# Altium project PCB_tesis.PrjPcb
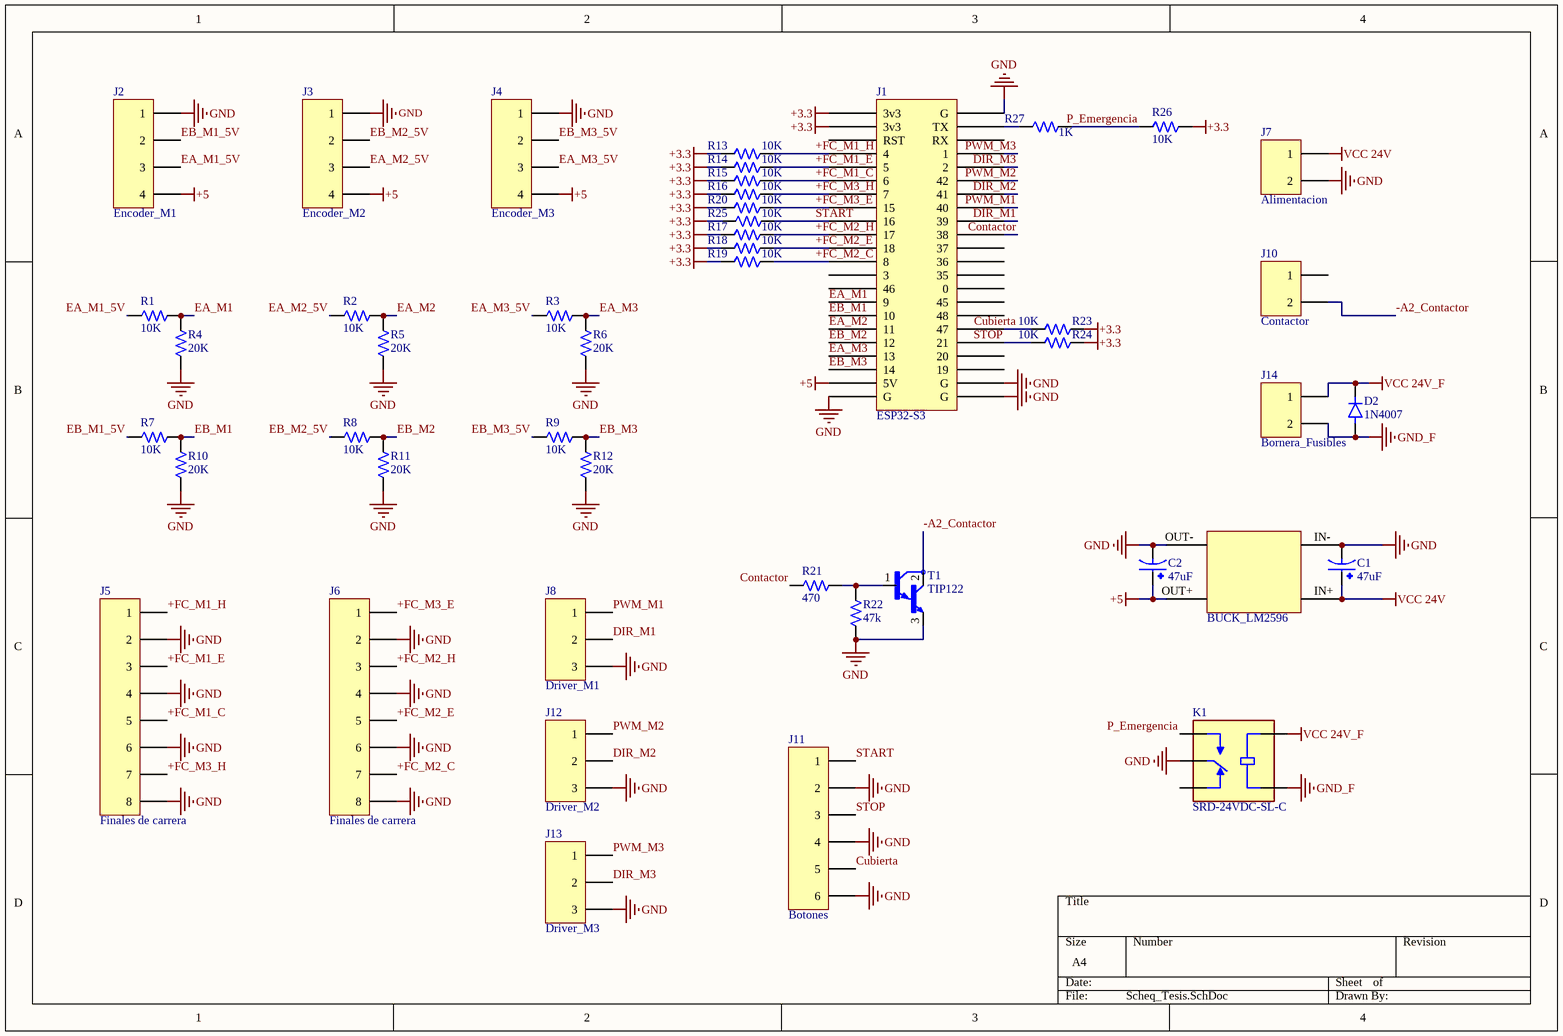
[diagram p0: Scheq_Tesis.SchDoc]
1 sheet, 46 parts. Net scope: global (net labels, ports and power ports of the same name join across sheets).
Board file: PCB_TESIS.PcbDoc

## Sheet Scheq_Tesis.SchDoc
size A4; SheetNumber: 1; SheetTotal: 1

### Parts
C1  47uF  [CAPPRD250W50D630H1120]
C2  47uF  [CAPPRD250W50D630H1120]
D2  1N4007  [DIOAD1060W80L520D270]
J1  ESP32-S3  [FootprintESP]
J2  Encoder_M1  [Bornera4_3.5mm]
J3  Encoder_M2  [Bornera4_3.5mm]
J4  Encoder_M3  [Bornera4_3.5mm]
J5  Finales de carrera  [Footprint bornera 8 pins]
J6  Finales de carrera  [Footprint bornera 8 pins]
J7  Alimentacion  [Bornera 2 5mm]
J8  Driver_M1  [Bornera 3 5mm]
J9  BUCK_LM2596  [BUCK_LM2596]
J10  Contactor  [Bornera 2 5mm]
J11  Botones  [footprint bornera 6]
J12  Driver_M2  [Bornera 3 5mm]
J13  Driver_M3  [Bornera 3 5mm]
J14  Bornera_Fusibles  [Bornera 2 5mm]
K1  SRD-24VDC-SL-C  [RELAY_SRD-12VDC-SL-C]
R1  10K  [RESAD1100W55L680D260]
R2  10K  [RESAD1100W55L680D260]
R3  10K  [RESAD1100W55L680D260]
R4  20K  [RESAD1100W55L680D260]
R5  20K  [RESAD1100W55L680D260]
R6  20K  [RESAD1100W55L680D260]
R7  10K  [RESAD1100W55L680D260]
R8  10K  [RESAD1100W55L680D260]
R9  10K  [RESAD1100W55L680D260]
R10  20K  [RESAD1100W55L680D260]
R11  20K  [RESAD1100W55L680D260]
R12  20K  [RESAD1100W55L680D260]
R13  10K  [RESAD1100W55L680D260]
R14  10K  [RESAD1100W55L680D260]
R15  10K  [RESAD1100W55L680D260]
R16  10K  [RESAD1100W55L680D260]
R17  10K  [RESAD1100W55L680D260]
R18  10K  [RESAD1100W55L680D260]
R19  10K  [RESAD1100W55L680D260]
R20  10K  [RESAD1100W55L680D260]
R21  470  [RESAD1100W55L680D260]
R22  47k  [RESAD1100W55L680D260]
R23  10K  [RESAD1100W55L680D260]
R24  10K  [RESAD1100W55L680D260]
R25  10K  [RESAD1100W55L680D260]
R26  10K  [RESAD1100W55L680D260]
R27  1K  [RESAD1100W55L680D260]
T1  TIP122  [TO220]

### Nets
+3.3: J1.1(3v3) J1.2(3v3) R13.1 R14.1 R15.1 R16.1 R17.1 R18.1 R19.1 R20.1 R23.2 R24.2 R25.2 R26.2
+5: C2.P J1.21(5V) J2.4 J3.4 J4.4 J9.OUT+
GND: C1.N C2.N J1.22(G) J1.23(G) J1.43(G) J1.44(G) J2.1 J3.1 J4.1 J5.2 J5.4 J5.6 J5.8 J6.2 J6.4 J6.6 J6.8 J7.2 J8.3 J9.IN- J9.OUT- J11.2 J11.4 J11.6 J12.3 J13.3 K1.COM R4.1 R5.1 R6.1 R10.1 R11.1 R12.1 R22.1 T1.3(E)
GND_F: D2.A J14.2 K1.COIL1
VCC 24V: C1.P J7.1 J9.IN+
VCC 24V_F: D2.C J14.1 K1.COIL2
+FC_M1_C: J1.6 J5.5 R15.2
+FC_M1_E: J1.5 J5.3 R14.2
+FC_M1_H: J1.4 J5.1 R13.2
+FC_M2_C: J1.12(8) J6.7 R19.2
+FC_M2_E: J1.11(18) J6.5 R18.2
+FC_M2_H: J1.10(17) J6.3 R17.2
+FC_M3_E: J1.8(15) J6.1 R20.2
+FC_M3_H: J1.7 J5.7 R16.2
-A2_Contactor: J10.2 T1.2(C)
Contactor: J1.32(38) R21.1
Cubierta: J1.39(47) J11.5 R23.1
DIR_M1: J1.31(39) J8.2
DIR_M2: J1.29(41) J12.2
DIR_M3: J1.27(2) J13.2
EA_M1: J1.15(9) R1.2 R4.2
EA_M1_5V: J2.3 R1.1
EA_M2: J1.17(11) R2.2 R5.2
EA_M2_5V: J3.3 R2.1
EA_M3: J1.19(13) R3.2 R6.2
EA_M3_5V: J4.3 R3.1
EB_M1: J1.16(10) R7.2 R10.2
EB_M1_5V: J2.2 R7.1
EB_M2: J1.18(12) R8.2 R11.2
EB_M2_5V: J3.2 R8.1
EB_M3: J1.20(14) R9.2 R12.2
EB_M3_5V: J4.2 R9.1
P_Emergencia: K1.NO R26.1 R27.2
PWM_M1: J1.30(40) J8.1
PWM_M2: J1.28(42) J12.1
PWM_M3: J1.26(1) J13.1
START: J1.9(16) J11.1 R25.1
STOP: J1.40(21) J11.3 R24.1
NetJ1_24: J1.24(TX) R27.1
NetR21_2: R21.2 R22.2 T1.1(B)

Not connected (* = marked no-connect by the designer): J1 3(RST) 13(3) 14(46) 25(RX) 33(37) 34(36) 35 36(0) 37(45) 38(48) 41(20) 42(19); J10 1; K1 NC

### Library data of the parts
C1 C2 = ECA1HM470: 47ÂµF 50V Aluminum Electrolytic Capacitors Radial, Can 2000 Hrs @ 85Â°C; MF: Panasonic Electronic; Value: *; MP: ECA1HM470; SnapEDA_Link: https://www.snapeda.com/parts/ECA1HM470/Panasonic%20Electronic%20Components/view-part/562975/?ref=snap; Availability: In Stock; Package: RADIAL-2 Panasonic; Price: None; Check_prices: https://www.snapeda.com/parts/ECA1HM470/Panasonic%20Electronic%20Components/view-part/562975/?ref=eda; Purchase-URL: https://pricing.snapeda.com/search/part/ECA1HM470/?ref=eda
D2 = 1N4007: Diode, DO-41, 1000V, 1A, 175Â°C; MF: Diotec Semiconductor; SnapEDA_Link: https://www.snapeda.com/parts/1N4007/Diotec/view-part/?ref=snap; Package: DO-41 Diotec; Value: *; MP: 1N4007; Check_prices: https://www.snapeda.com/parts/1N4007/Diotec/view-part/?ref=eda
J2-J4 = Bornera4_3.5mm
J5 J6 = Bornera8
J7 J10 J14 = Bornera2_5mm
J8 J12 J13 = Bornera3_5mm
J11 = Bornera6
K1 = SRD-12VDC-SL-C: General Purpose Non Latching 12VDC SPDT Through Hole Relays RoHS; MF: Songle Relay; SnapEDA_Link: https://www.snapeda.com/parts/SRD-12VDC-SL-C/Songle+Relay/view-part/?ref=snap; Package: NON STANDARD-5 Songle Relay; Value: *; MP: SRD-12VDC-SL-C; Check_prices: https://www.snapeda.com/parts/SRD-12VDC-SL-C/Songle+Relay/view-part/?ref=eda
R1-R3 R7-R9 R13-R20 R22-R27 = 10K: 10.2 kOhms Â±1% 0.25W, 1/4W Through Hole Resistor Axial - Metal Film; MF: Yageo; MP: MFR-25FBF52-10K; SnapEDA_Link: https://www.snapeda.com/parts/MFR-25FBF52-10K/Yageo/view-part/?ref=snap; Package: RADIAL-2 YAGEO; Value: *; Check_prices: https://www.snapeda.com/parts/MFR-25FBF52-10K/Yageo/view-part/?ref=eda
R4-R6 R10-R12 = 20K: 10.2 kOhms Â±1% 0.25W, 1/4W Through Hole Resistor Axial - Metal Film; MF: Yageo; MP: MFR-25FBF52-10K; SnapEDA_Link: https://www.snapeda.com/parts/MFR-25FBF52-10K/Yageo/view-part/?ref=snap; Package: RADIAL-2 YAGEO; Value: *; Check_prices: https://www.snapeda.com/parts/MFR-25FBF52-10K/Yageo/view-part/?ref=eda
R21 = 220: 10.2 kOhms Â±1% 0.25W, 1/4W Through Hole Resistor Axial - Metal Film; MF: Yageo; MP: MFR-25FBF52-10K; SnapEDA_Link: https://www.snapeda.com/parts/MFR-25FBF52-10K/Yageo/view-part/?ref=snap; Package: RADIAL-2 YAGEO; Value: *; Check_prices: https://www.snapeda.com/parts/MFR-25FBF52-10K/Yageo/view-part/?ref=eda
T1 = TIP122: Bipolar (BJT) Transistor NPN - Darlington 100 V 5 A - 2 W Through Hole TO-220-3; MF: ON Semiconductor; SnapEDA_Link: https://www.snapeda.com/parts/TIP122/Onsemi/view-part/?ref=snap; Package: TO-220-3 ON Semiconductor; Value: *; MP: TIP122; Check_prices: https://www.snapeda.com/parts/TIP122/Onsemi/view-part/?ref=eda